# Altium schematic sheet Sheet2_Hierarquia.SchDoc
size A4; SheetNumber: 2; SheetTotal: 6
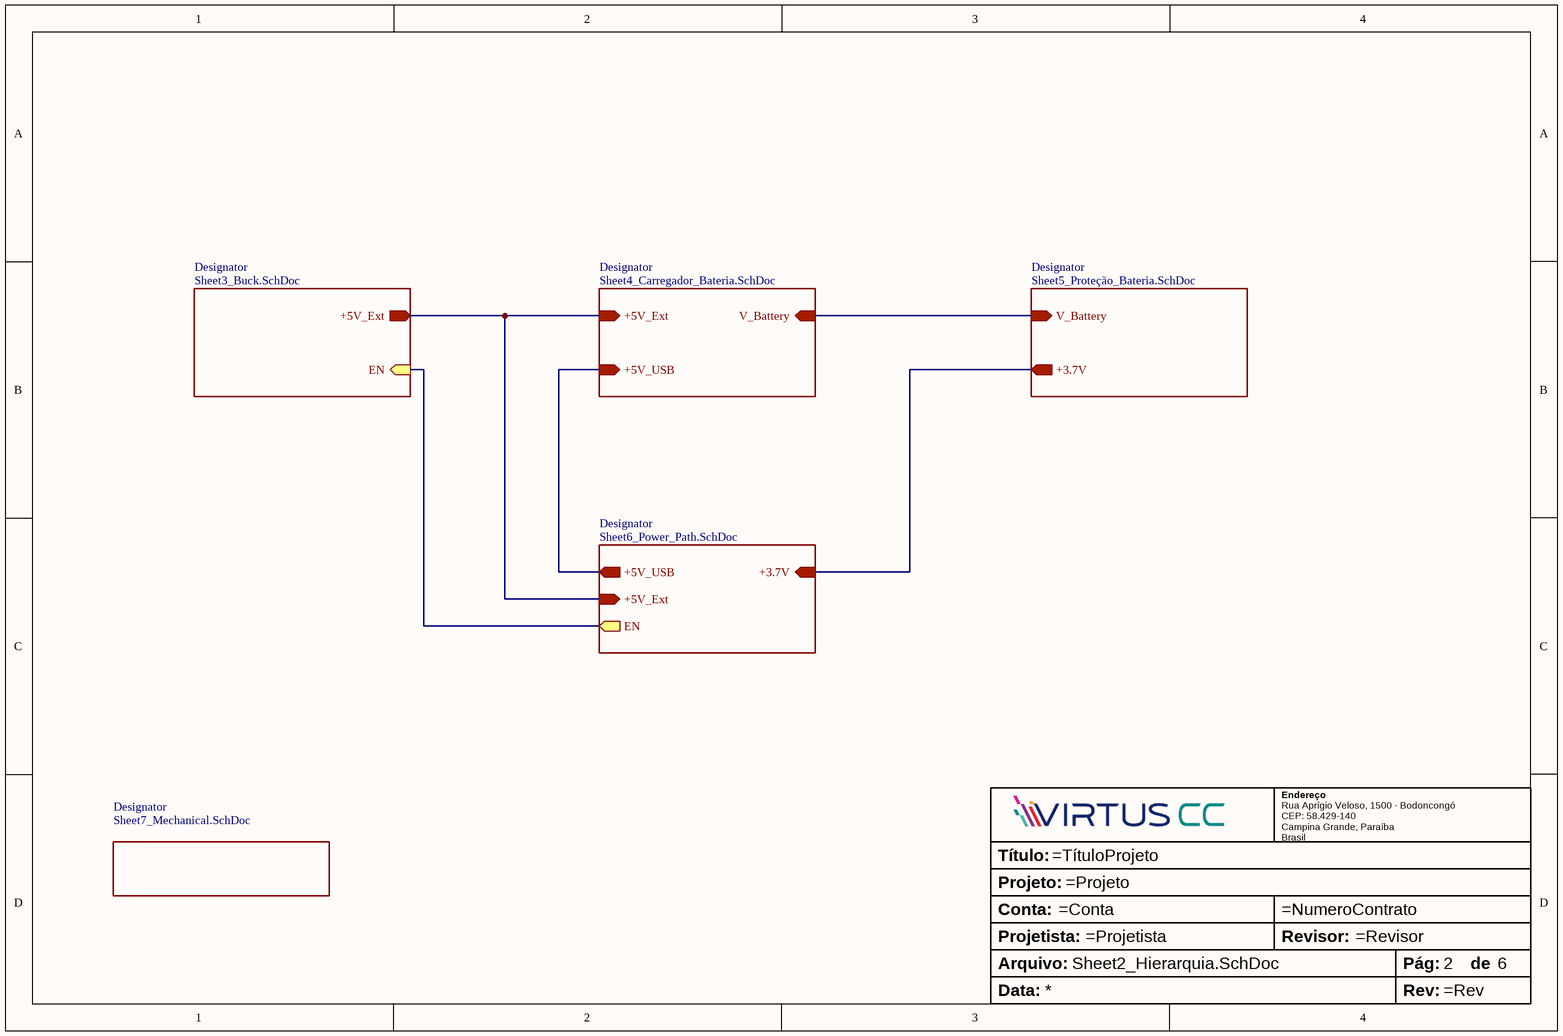
[diagram p0: Sheet2_Hierarquia.SchDoc]

## Parts
TB?  Title Block  (value not drawn)  (graphical)

## Sub-sheets
Designator = Sheet3_Buck.SchDoc: EN (in), +5V_Ext (out)
Designator = Sheet4_Carregador_Bateria.SchDoc: +5V_Ext (in), +5V_USB (in), V_Battery (in)
Designator = Sheet5_Proteção_Bateria.SchDoc: +3.7V (out), V_Battery (in)
Designator = Sheet6_Power_Path.SchDoc: +3.7V (in), +5V_Ext (in), EN (out), +5V_USB (out)
Designator = Sheet7_Mechanical.SchDoc: no entries

## Nets
(unnamed): sheet Designator/EN, sheet Designator/EN
(unnamed): sheet Designator/+5V_Ext, sheet Designator/+5V_Ext, sheet Designator/+5V_Ext
(unnamed): sheet Designator/+5V_USB, sheet Designator/+5V_USB
(unnamed): sheet Designator/V_Battery, sheet Designator/V_Battery
(unnamed): sheet Designator/+3.7V, sheet Designator/+3.7V

## Notes on the sheet
- (in symbol Title Block) Endereço; Título:; Rua Aprígio Veloso, 1500 - Bodoncongó / CEP: 58.429-140 / Campina Grande, Paraíba / Brasil; Projeto:; Conta:; Projetista:; Revisor:; Arquivo:; Pág:; de; Data:; Rev: